# Altium schematic sheet PCB-MAIN_06_LORA.SchDoc
size 594 x 420 mm
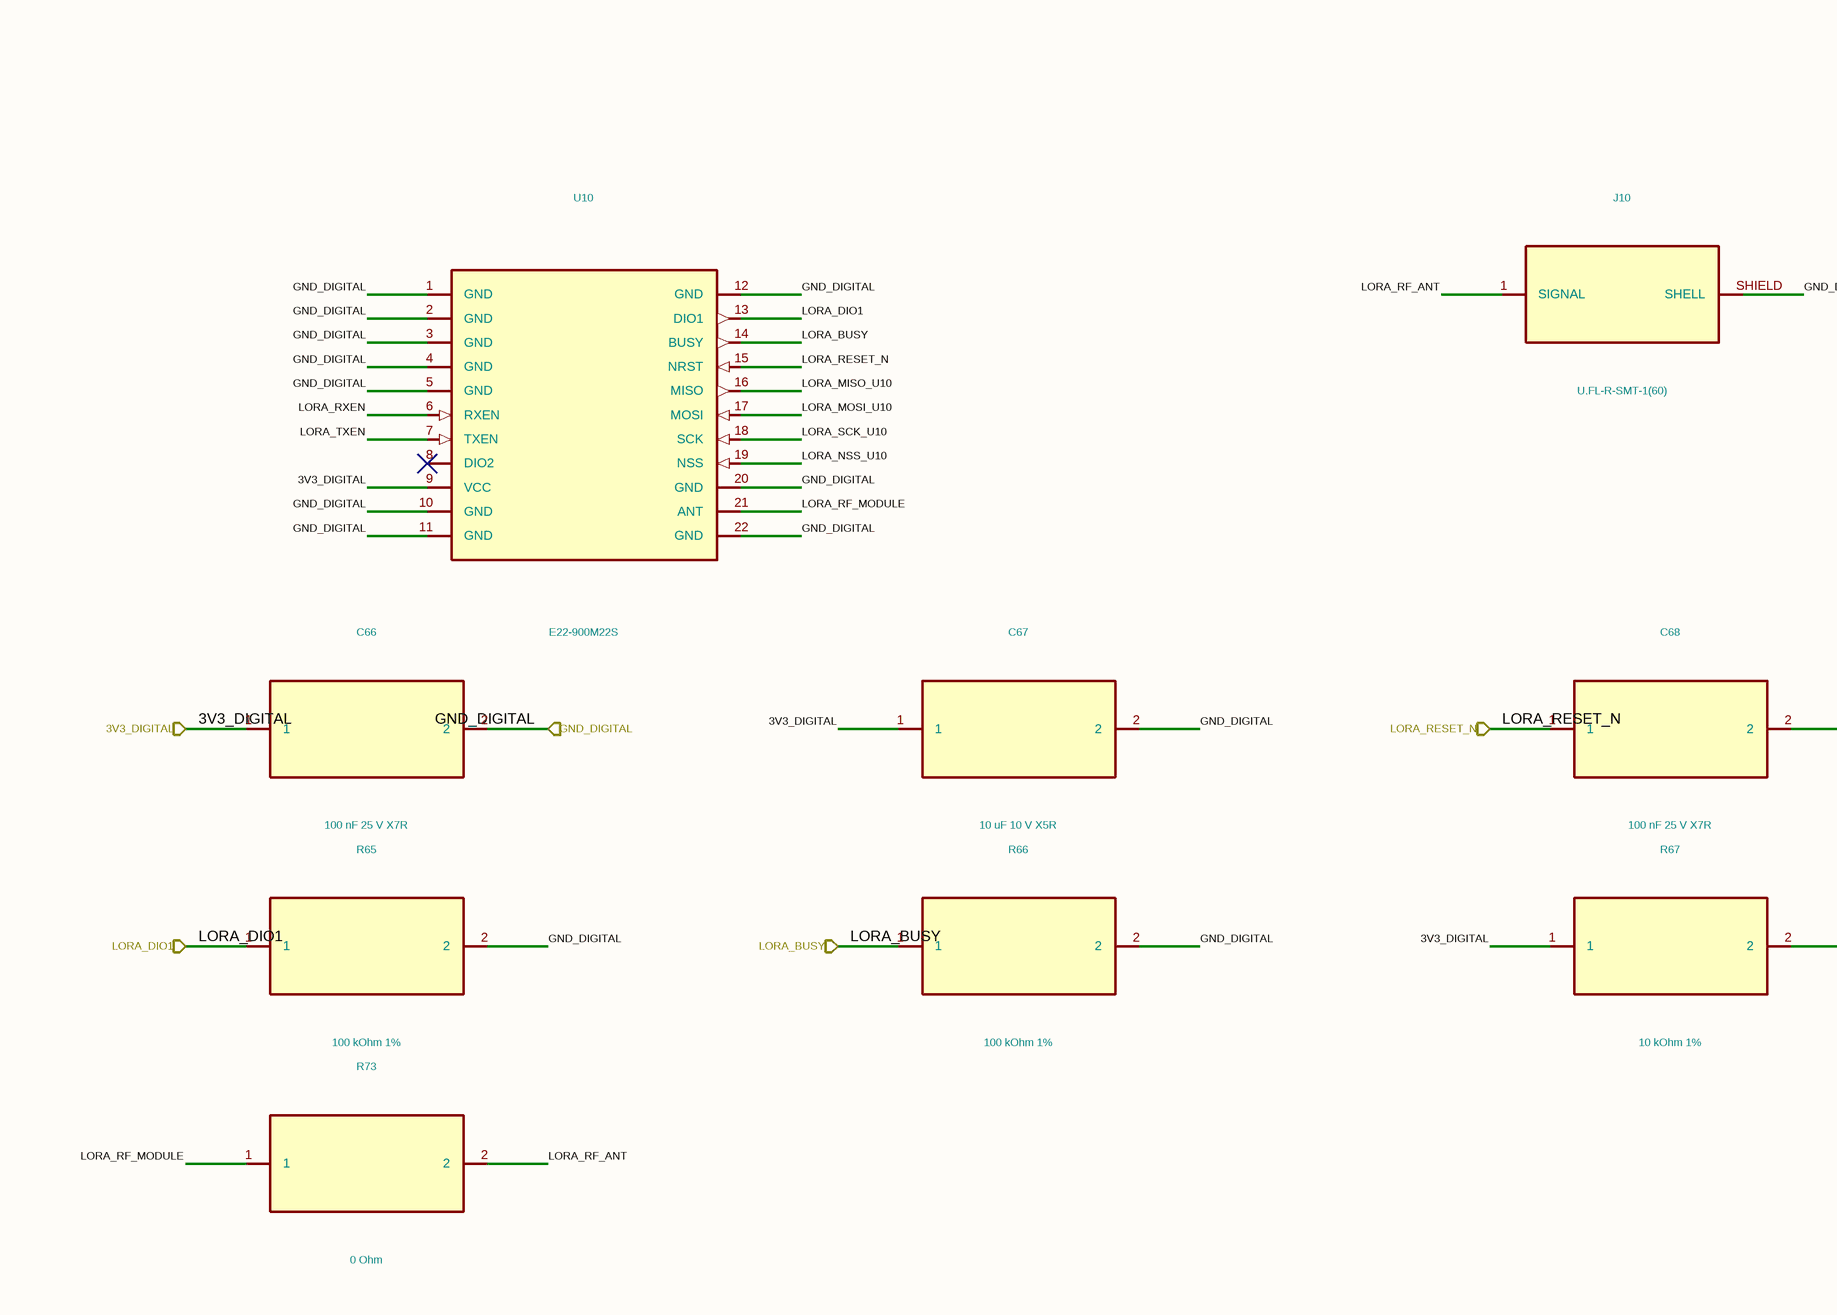
[diagram p0: PCB-MAIN_06_LORA.SchDoc, top left]
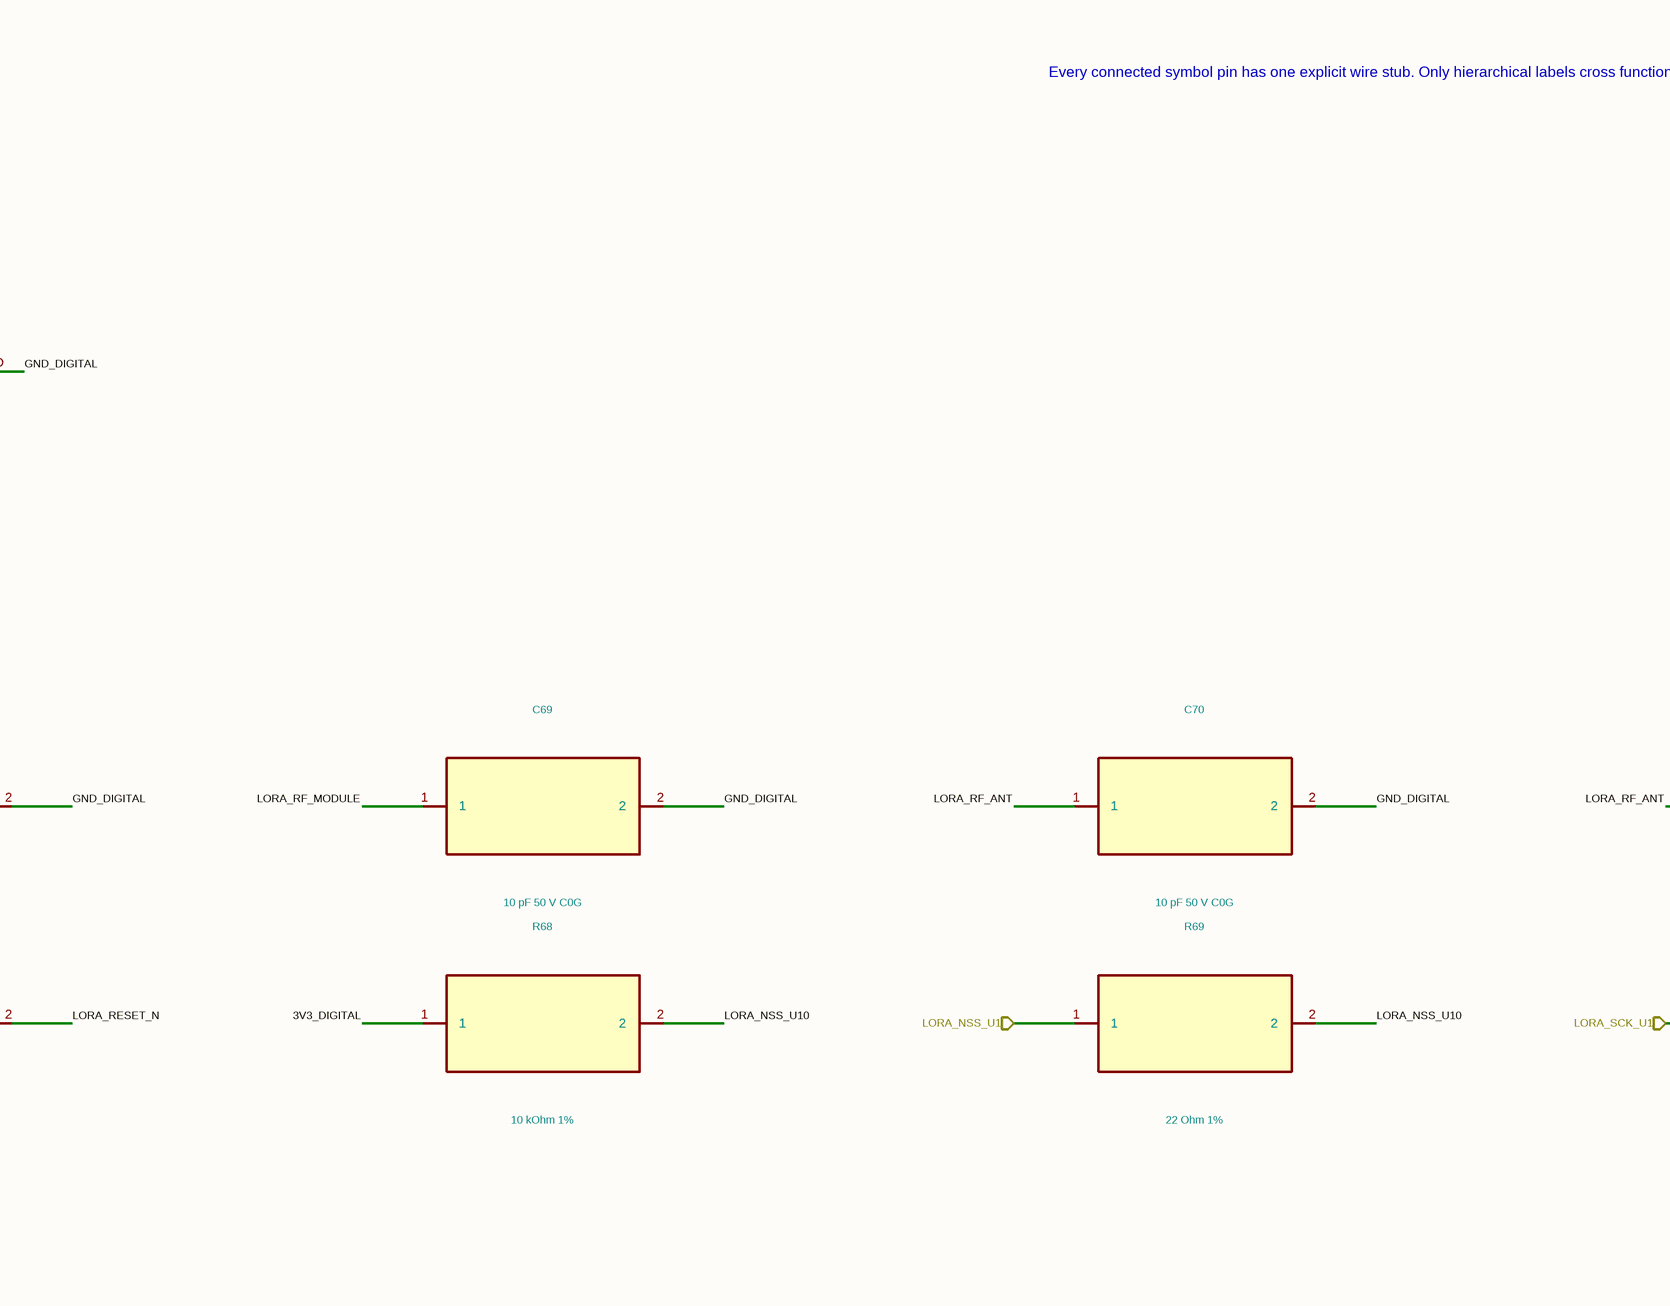
[diagram p1: PCB-MAIN_06_LORA.SchDoc, top middle]
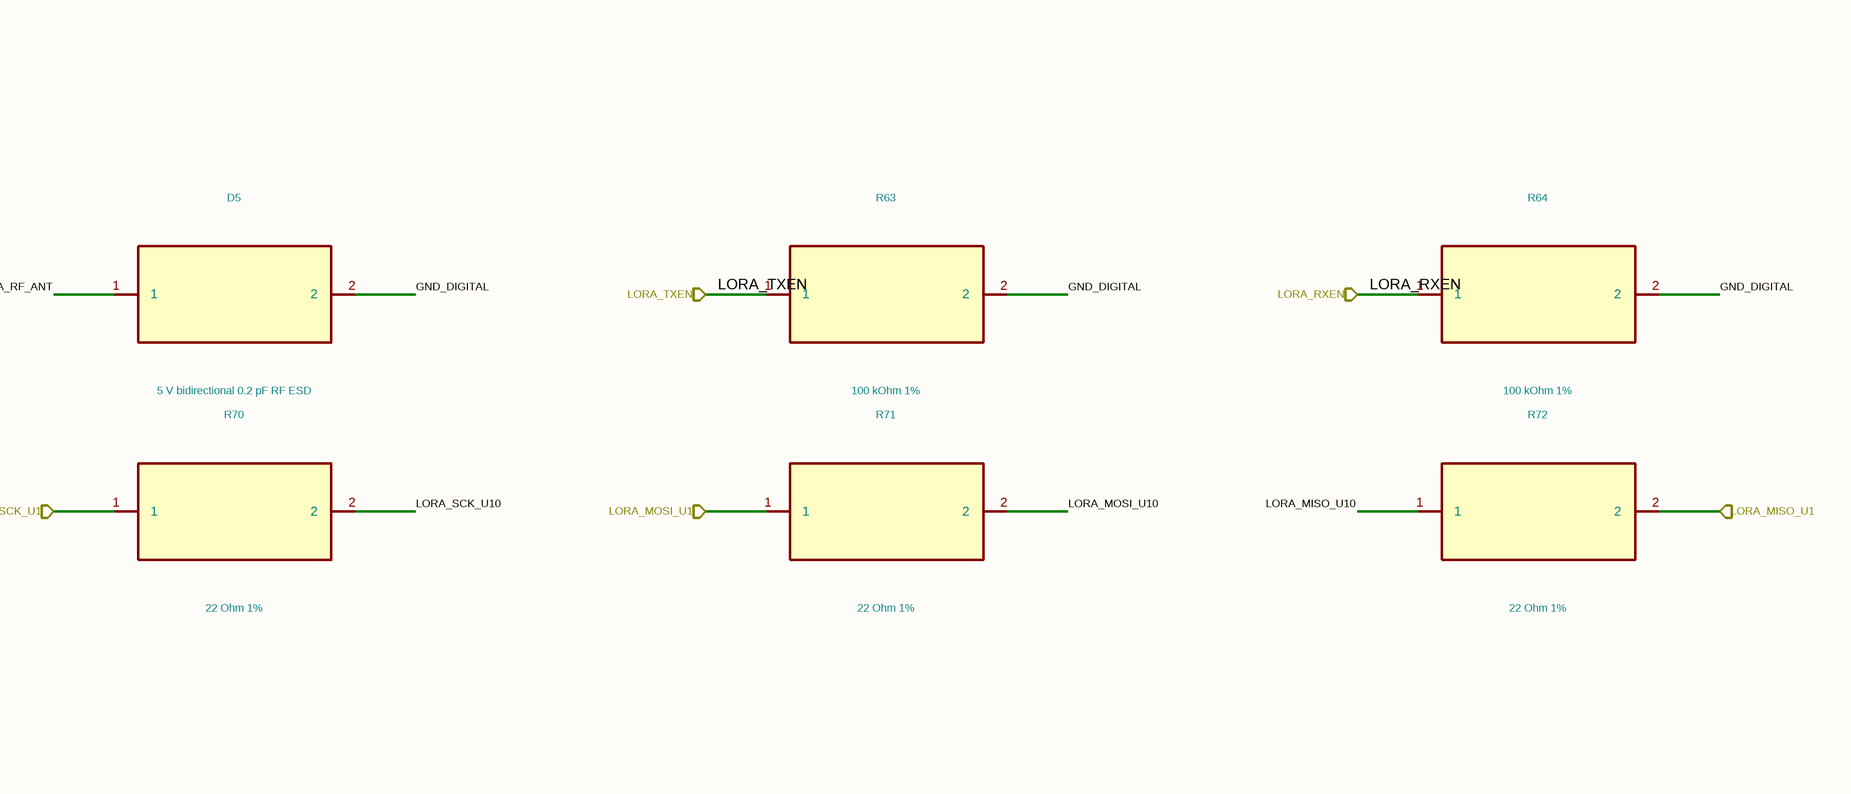
[diagram p2: PCB-MAIN_06_LORA.SchDoc, top right]
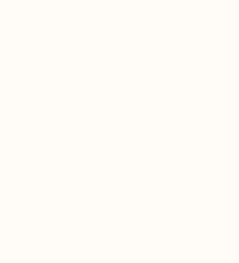
[diagram p3: PCB-MAIN_06_LORA.SchDoc, bottom left]

## Parts
C66  100 nF 25 V X7R  [C_0402_1005Metric]
C67  10 uF 10 V X5R  [C_0603_1608Metric]
C68  100 nF 25 V X7R  [C_0402_1005Metric]
C69  10 pF 50 V C0G  [C_0402_1005Metric]
C70  10 pF 50 V C0G  [C_0402_1005Metric]
D5  5 V bidirectional 0.2 pF RF ESD
J10  U.FL-R-SMT-1(60)
R63  100 kOhm 1%  [R_0402_1005Metric]
R64  100 kOhm 1%  [R_0402_1005Metric]
R65  100 kOhm 1%  [R_0402_1005Metric]
R66  100 kOhm 1%  [R_0402_1005Metric]
R67  10 kOhm 1%  [R_0402_1005Metric]
R68  10 kOhm 1%  [R_0402_1005Metric]
R69  22 Ohm 1%  [R_0402_1005Metric]
R70  22 Ohm 1%  [R_0402_1005Metric]
R71  22 Ohm 1%  [R_0402_1005Metric]
R72  22 Ohm 1%  [R_0402_1005Metric]
R73  0 Ohm  [R_0402_1005Metric]
U10  E22-900M22S

## Ports
3V3_DIGITAL, GND_DIGITAL, LORA_BUSY, LORA_DIO1, LORA_MISO_U1, LORA_MOSI_U1, LORA_NSS_U1, LORA_RESET_N, LORA_RXEN, LORA_SCK_U1, LORA_TXEN

## Nets
3V3_DIGITAL: C66.1 C67.1 R67.1 R68.1 U10.9(VCC) ; port 3V3_DIGITAL
GND_DIGITAL: C66.2 C67.2 C68.2 C69.2 C70.2 D5.2 J10.SHIELD(SHELL) R63.2 R64.2 R65.2 R66.2 U10.1(GND) U10.2(GND) U10.3(GND) U10.4(GND) U10.5(GND) U10.10(GND) U10.11(GND) U10.12(GND) U10.20(GND) U10.22(GND) ; port GND_DIGITAL
LORA_BUSY: R66.1 U10.14(BUSY) ; port LORA_BUSY
LORA_DIO1: R65.1 U10.13(DIO1) ; port LORA_DIO1
LORA_MISO_U1: R72.2 ; port LORA_MISO_U1
LORA_MISO_U10: R72.1 U10.16(MISO)
LORA_MOSI_U1: R71.1 ; port LORA_MOSI_U1
LORA_MOSI_U10: R71.2 U10.17(MOSI)
LORA_NSS_U1: R69.1 ; port LORA_NSS_U1
LORA_NSS_U10: R68.2 R69.2 U10.19(NSS)
LORA_RESET_N: C68.1 R67.2 U10.15(NRST) ; port LORA_RESET_N
LORA_RF_ANT: C70.1 D5.1 J10.1(SIGNAL) R73.2
LORA_RF_MODULE: C69.1 R73.1 U10.21(ANT)
LORA_RXEN: R64.1 U10.6(RXEN) ; port LORA_RXEN
LORA_SCK_U1: R70.1 ; port LORA_SCK_U1
LORA_SCK_U10: R70.2 U10.18(SCK)
LORA_TXEN: R63.1 U10.7(TXEN) ; port LORA_TXEN

Not connected (* = marked no-connect by the designer): U10 8(DIO2)*

## Notes on the sheet
- Every connected symbol pin has one explicit wire stub. Only hierarchical labels cross functional-sheet boundaries.
- 1
- 2
- 3
- 4
- 5
- 6
- 7
- 8
- 9
- 10
- 11
- A
- B
- C
- D
- E
- F
- G
- H
- Human-readable hierarchy candidate; exact Review-A pin/net equivalence enforced
- Functional sheet 7 of 10
- NOT FOR MANUFACTURE - hierarchy review/routing/DRC/DFM/Review B pending
- Title: Dioneya PCB-MAIN Rev.A - LoRa
- File: PCB-MAIN_06_LORA.kicad_sch
- Sheet: /
- Dioneya / ZS-BPLA
- KiCad E.D.A.  kicad (5.1.4)-1
- Size: A2
- Date: 2026-09-16
- Rev: A
- Id: 1/1

## Library data of the parts
C66 = C66_GRM155R71E104KE14D: Manufacturer: Murata; Population: FITTED; Authority: Ebyte_E22-M_v1.2; MPN: GRM155R71E104KE14D; Package: 0402; Value: 100 nF 25 V X7R; Footprint: Capacitor_SMD:C_0402_1005Metric
C67 = C67_GRM188R61A106KE69D: Manufacturer: Murata; Population: FITTED; Authority: Ebyte_E22-M_v1.2; MPN: GRM188R61A106KE69D; Package: 0603; Value: 10 uF 10 V X5R; Footprint: Capacitor_SMD:C_0603_1608Metric
C68 = C68_GRM155R71E104KE14D: Manufacturer: Murata; Population: FITTED; Authority: Ebyte_E22-M_v1.2; MPN: GRM155R71E104KE14D; Package: 0402; Value: 100 nF 25 V X7R; Footprint: Capacitor_SMD:C_0402_1005Metric
C69 = C69_GRM1555C1H100JA01D: Manufacturer: Murata; Population: DNP; Authority: Ebyte_E22-M_v1.2; MPN: GRM1555C1H100JA01D; Package: 0402; Value: 10 pF 50 V C0G; Footprint: Capacitor_SMD:C_0402_1005Metric
C70 = C70_GRM1555C1H100JA01D: Manufacturer: Murata; Population: DNP; Authority: Ebyte_E22-M_v1.2; MPN: GRM1555C1H100JA01D; Package: 0402; Value: 10 pF 50 V C0G; Footprint: Capacitor_SMD:C_0402_1005Metric
D5 = D5_PESD5V0C1BSF: Manufacturer: Nexperia; Population: FITTED; Authority: Nexperia_PESD5V0C1BSF_v3; MPN: PESD5V0C1BSF; Package: SOD962-2; Value: 5 V bidirectional 0.2 pF RF ESD
J10 = J10_U.FL-R-SMT-1_60: Manufacturer: CONTROLLED_AUTHORITY; Population: FITTED; Authority: PCB_MAIN_LORA_PIN_AUTHORITY_REV_A.csv;PCB_MAIN_CONNECTOR_FIXTURE_PIN_AUTHORITY_REV_A.csv; MPN: U.FL-R-SMT-1(60); Package: U.FL_SMT; Value: U.FL-R-SMT-1(60)
R63 = R63_ERJ-2RKF1003X: Manufacturer: Panasonic; Population: FITTED; Authority: Ebyte_E22-M_v1.2; MPN: ERJ-2RKF1003X; Package: 0402; Value: 100 kOhm 1%; Footprint: Resistor_SMD:R_0402_1005Metric
R64 = R64_ERJ-2RKF1003X: Manufacturer: Panasonic; Population: FITTED; Authority: Ebyte_E22-M_v1.2; MPN: ERJ-2RKF1003X; Package: 0402; Value: 100 kOhm 1%; Footprint: Resistor_SMD:R_0402_1005Metric
R65 = R65_ERJ-2RKF1003X: Manufacturer: Panasonic; Population: FITTED; Authority: Ebyte_E22-M_v1.2; MPN: ERJ-2RKF1003X; Package: 0402; Value: 100 kOhm 1%; Footprint: Resistor_SMD:R_0402_1005Metric
R66 = R66_ERJ-2RKF1003X: Manufacturer: Panasonic; Population: FITTED; Authority: Ebyte_E22-M_v1.2; MPN: ERJ-2RKF1003X; Package: 0402; Value: 100 kOhm 1%; Footprint: Resistor_SMD:R_0402_1005Metric
R67 = R67_ERJ-2RKF1002X: Manufacturer: Panasonic; Population: FITTED; Authority: Ebyte_E22-M_v1.2; MPN: ERJ-2RKF1002X; Package: 0402; Value: 10 kOhm 1%; Footprint: Resistor_SMD:R_0402_1005Metric
R68 = R68_ERJ-2RKF1002X: Manufacturer: Panasonic; Population: FITTED; Authority: Ebyte_E22-M_v1.2; MPN: ERJ-2RKF1002X; Package: 0402; Value: 10 kOhm 1%; Footprint: Resistor_SMD:R_0402_1005Metric
R69 = R69_ERJ-2RKF22R0X: Manufacturer: Panasonic; Population: FITTED; Authority: Ebyte_E22-M_v1.2; MPN: ERJ-2RKF22R0X; Package: 0402; Value: 22 Ohm 1%; Footprint: Resistor_SMD:R_0402_1005Metric
R70 = R70_ERJ-2RKF22R0X: Manufacturer: Panasonic; Population: FITTED; Authority: Ebyte_E22-M_v1.2; MPN: ERJ-2RKF22R0X; Package: 0402; Value: 22 Ohm 1%; Footprint: Resistor_SMD:R_0402_1005Metric
R71 = R71_ERJ-2RKF22R0X: Manufacturer: Panasonic; Population: FITTED; Authority: Ebyte_E22-M_v1.2; MPN: ERJ-2RKF22R0X; Package: 0402; Value: 22 Ohm 1%; Footprint: Resistor_SMD:R_0402_1005Metric
R72 = R72_ERJ-2RKF22R0X: Manufacturer: Panasonic; Population: FITTED; Authority: Ebyte_E22-M_v1.2; MPN: ERJ-2RKF22R0X; Package: 0402; Value: 22 Ohm 1%; Footprint: Resistor_SMD:R_0402_1005Metric
R73 = R73_ERJ-2GE0R00X: Manufacturer: Panasonic; Population: FITTED; Authority: Ebyte_E22-M_v1.2; MPN: ERJ-2GE0R00X; Package: 0402; Value: 0 Ohm; Footprint: Resistor_SMD:R_0402_1005Metric
U10 = U10_E22-900M22S: Manufacturer: Ebyte; Population: FITTED; Authority: PCB_MAIN_LORA_PIN_AUTHORITY_REV_A.csv; MPN: E22-900M22S; Package: SMD_20x14_22P_1.27mm; Value: E22-900M22S